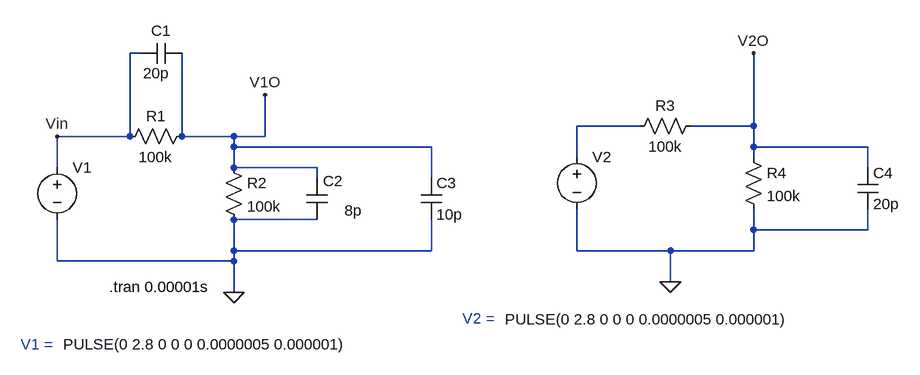
[diagram p0: schematic Compensated_Attenuator.asc]
Compensated_Attenuator.asc, the LTspice schematic file:
Version 4.1
SHEET 1 1460 680
WIRE 80 -32 64 -32
WIRE 848 80 752 80
WIRE 1024 80 1024 -32
WIRE 1024 80 928 80
WIRE 64 96 64 -32
WIRE 64 96 -48 96
WIRE 144 96 144 -32
WIRE 224 96 144 96
WIRE 272 96 272 32
WIRE 272 96 224 96
WIRE 224 112 224 96
WIRE 528 112 224 112
WIRE 1024 112 1024 80
WIRE 1200 112 1024 112
WIRE 752 128 752 80
WIRE 1024 128 1024 112
WIRE -48 144 -48 96
WIRE 224 144 224 112
WIRE 352 144 224 144
WIRE 1200 144 1200 112
WIRE 352 160 352 144
WIRE 528 160 528 112
WIRE 352 224 224 224
WIRE 1024 240 1024 208
WIRE 1200 240 1200 208
WIRE 1200 240 1024 240
WIRE 224 272 224 224
WIRE 528 272 528 224
WIRE 528 272 224 272
WIRE 752 272 752 208
WIRE 896 272 752 272
WIRE 1024 272 1024 240
WIRE 1024 272 896 272
WIRE -48 288 -48 224
WIRE 224 288 224 272
WIRE 224 288 -48 288
WIRE 896 320 896 272
WIRE 224 336 224 288
FLAG 224 336 0
FLAG 896 320 0
FLAG 272 32 V1O
FLAG 1024 -32 V2O
FLAG -48 96 Vin
SYMBOL res 160 80 R90
WINDOW 0 0 56 VBottom 2
WINDOW 3 32 56 VTop 2
SYMATTR InstName R1
SYMATTR Value 100k
SYMBOL res 208 128 R0
SYMATTR InstName R2
SYMATTR Value 100k
SYMBOL cap 144 -48 R90
WINDOW 0 -3 32 VBottom 2
WINDOW 3 31 39 VTop 2
SYMATTR InstName C1
SYMATTR Value 20p
SYMBOL cap 368 224 R180
WINDOW 0 -24 59 Left 2
WINDOW 3 -53 14 Left 2
SYMATTR InstName C2
SYMATTR Value 8p
SYMBOL voltage -48 128 R0
WINDOW 3 9 288 Left 2
WINDOW 123 0 0 Left 0
WINDOW 39 0 0 Left 0
SYMATTR Value PULSE(0 2.8 0 0 0 0.0000005 0.000001)
SYMATTR InstName V1
SYMBOL res 944 64 R90
WINDOW 0 0 56 VBottom 2
WINDOW 3 32 56 VTop 2
SYMATTR InstName R3
SYMATTR Value 100k
SYMBOL res 1008 112 R0
SYMATTR InstName R4
SYMATTR Value 100k
SYMBOL voltage 752 112 R0
WINDOW 3 -111 266 Left 2
WINDOW 123 0 0 Left 0
WINDOW 39 0 0 Left 0
SYMATTR Value PULSE(0 2.8 0 0 0 0.0000005 0.000001)
SYMATTR InstName V2
SYMBOL cap 512 160 R0
SYMATTR InstName C3
SYMATTR Value 10p
SYMBOL cap 1184 144 R0
SYMATTR InstName C4
SYMATTR Value 20p
TEXT 32 328 Left 2 !.tran 0.00001s
TEXT -104 416 Left 2 ;V1 =
TEXT 576 376 Left 2 ;V2 =

The netlist it stands for:
* Compensated_Attenuator.asc
R1 V1O Vin 100k
R2 V1O 0 100k
C1 V1O Vin 20p
C2 0 V1O 8p
V1 Vin 0 PULSE(0 2.8 0 0 0 0.0000005 0.000001)
R3 V2O N001 100k
R4 V2O 0 100k
V2 N001 0 PULSE(0 2.8 0 0 0 0.0000005 0.000001)
C3 V1O 0 10p
C4 V2O 0 20p
.tran 0.00001s
* V1 =
* V2 =
.backanno
.end

* Results of the author's LTspice run, read from the files saved beside the schematic
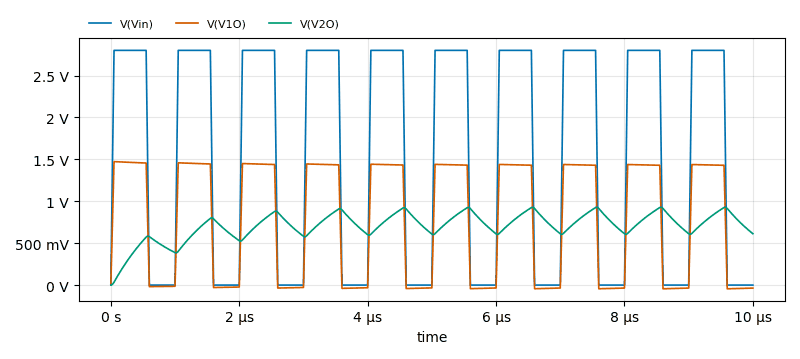
[diagram p1: Transient Analysis of Compensated_Attenuator.asc, plotted from the saved traces]
* Transient Analysis, 1 run:
*   V(Vin): min 0 V, max 2.8 V, average 1.54 V, rms 2.046 V, last 0 V
*   V(V1O): min -44.43 mV, max 1.473 V, average 776.8 mV, rms 1.052 V, last -36 mV
*   V(V2O): min 0 V, max 929.1 mV, average 708.7 mV, rms 726.5 mV, last 612.6 mV